# Altium schematic sheet dual_drive_babyyy.SchDoc
size A4; SheetNumber: 1; SheetTotal: 1
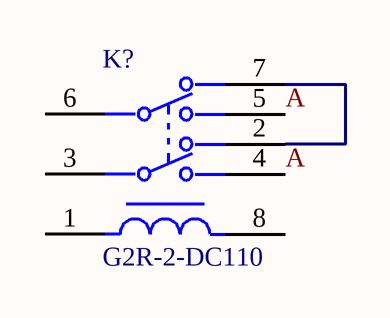
[diagram p0: dual_drive_babyyy.SchDoc]

## Parts
K?  G2R-2-DC110  [FP-G2R-2-DC110-MFG]

## Nets
A: K?.4 K?.5
NetK?_2: K?.2 K?.7

Not connected (* = marked no-connect by the designer): K? 1 3 6 8

## Library data of the parts
K? = CMP-08822-000193-1: RELAY GEN PURPOSE DPDT 5A 110V; Coil Resistance: 22.9kR; Coil Type: Non-Latching; Max Voltage Rating (DC): 125V; Max Voltage Rating (AC): 380V; Relay Type: General Purpose; Coil Power: 530mW; Operate Time: 15ms; Release Time: 5ms; Coil Current: 4.8mA; Packaging: Tray; Min Operating Temperature: -40°C; Max Operating Temperature: 70°C; Contact Current Rating: 5A; Number of Pins: 8; Contact Material: Silver; Termination: PC Pin; Coil Voltage (DC): 110V; Series: G2R; Throw Configuration: DPDT; Max Current Rating: 5A; Lead Free: Lead Free; Package Quantity: 100; RoHS Compliant: Yes; Mount: Through Hole